# Altium schematic sheet Buck.SchDoc
size A4; DrawnBy: George Evanisko; SheetNumber: 5; SheetTotal: 7
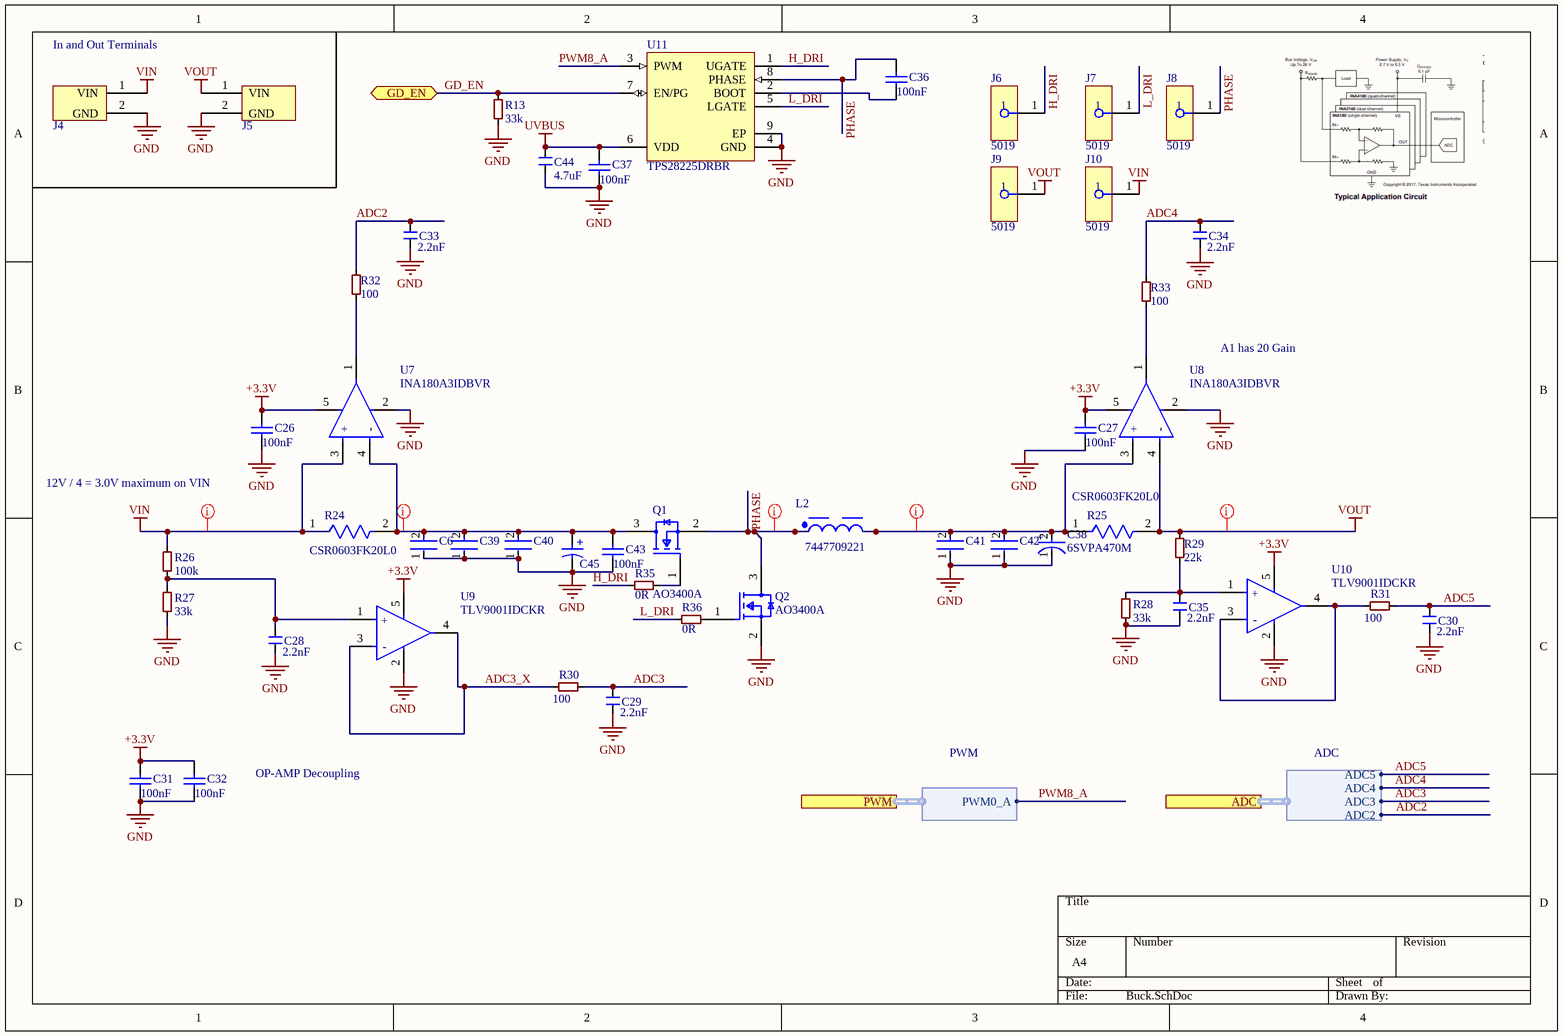
[diagram p0: Buck.SchDoc]

## Parts
C6  GRM31CC81E226ME11L  [FP-GRM31C-0_3-e0_3_0_8-IPC_B]  (value not drawn)
C26  Capacitance: 100nF  [CAPC1050X55X23ML05T13]  (hidden comment: CL05B104KO5NNNC)
C27  Capacitance: 100nF  [CAPC1050X55X23ML05T13]  (hidden comment: CL05B104KO5NNNC)
C28  C: 2.2nF  [0402 Resistor]  (hidden comment: CC0402KRX7R6BB222)
C29  C: 2.2nF  [0402 Resistor]  (hidden comment: CC0402KRX7R6BB222)
C30  C: 2.2nF  [0402 Resistor]  (hidden comment: CC0402KRX7R6BB222)
C31  Capacitance: 100nF  [CAPC1050X55X23ML05T13]  (hidden comment: CL05B104KO5NNNC)
C32  Capacitance: 100nF  [CAPC1050X55X23ML05T13]  (hidden comment: CL05B104KO5NNNC)
C33  C: 2.2nF  [0402 Resistor]  (hidden comment: CC0402KRX7R6BB222)
C34  C: 2.2nF  [0402 Resistor]  (hidden comment: CC0402KRX7R6BB222)
C35  C: 2.2nF  [0402 Resistor]  (hidden comment: CC0402KRX7R6BB222)
C36  Capacitance: 100nF  [CAPC1050X55X23ML05T13]  (hidden comment: CL05B104KO5NNNC)
C37  Capacitance: 100nF  [CAPC1050X55X23ML05T13]  (hidden comment: CL05B104KO5NNNC)
C38  6SVPA470M  [FP-OS-CON-SMT-F8-MFG]
C39  GRM31CC81E226ME11L  [FP-GRM31C-0_3-e0_3_0_8-IPC_B]  (value not drawn)
C40  GRM31CC81E226ME11L  [FP-GRM31C-0_3-e0_3_0_8-IPC_B]  (value not drawn)
C41  GRM31CC81E226ME11L  [FP-GRM31C-0_3-e0_3_0_8-IPC_B]  (value not drawn)
C42  GRM31CC81E226ME11L  [FP-GRM31C-0_3-e0_3_0_8-IPC_B]  (value not drawn)
C43  Capacitance: 100nF  [CAPC1050X55X23ML05T13]  (hidden comment: CL05B104KO5NNNC)
C44  4.7uF  [0402 Resistor]
C45  865060653010  [WCAP-ASLL_D8H10.5]  (value not drawn)
J4  DG127-5.08-02P-14-02A(H)  [DEGSON DG127-5.08-02P-14-02A(H)]  (value not drawn)
J5  DG127-5.08-02P-14-02A(H)  [DEGSON DG127-5.08-02P-14-02A(H)]  (value not drawn)
J6  5019  [5019_MFG]
J7  5019  [5019_MFG]
J8  5019  [5019_MFG]
J9  5019  [5019_MFG]
J10  5019  [5019_MFG]
L2  7447709221  [WE-PD_1210]
Q1  AO3400A  [FP-SOT23-MFG]
Q2  AO3400A  [FP-SOT23-MFG]
R13  R: 33k  [0402 Resistor]  (hidden comment: FRC0402F3302TS)
R24  CSR0603FK20L0  [FP-CSR0603-IPC_C]
R25  CSR0603FK20L0  [FP-CSR0603-IPC_C]
R26  R: 100k  [0402 Resistor]  (hidden comment: FRC0402F1003TS)
R27  R: 33k  [0402 Resistor]  (hidden comment: FRC0402F3302TS)
R28  R: 33k  [0402 Resistor]  (hidden comment: FRC0402F3302TS)
R29  R: 22k  [0402 Resistor]  (hidden comment: FRC0402F2202TS)
R30  R: 100  [0402 Resistor]  (hidden comment: FRC0402F1000TS)
R31  R: 100  [0402 Resistor]  (hidden comment: FRC0402F1000TS)
R32  R: 100  [0402 Resistor]  (hidden comment: FRC0402F1000TS)
R33  R: 100  [0402 Resistor]  (hidden comment: FRC0402F1000TS)
R35  R: 0R  [0402 Resistor]  (hidden comment: FRC0402F0000TS)
R36  R: 0R  [0402 Resistor]  (hidden comment: FRC0402F0000TS)
U7  INA180A3IDBVR  [FP-DBV0005A-IPC_A]
U8  INA180A3IDBVR  [FP-DBV0005A-IPC_A]
U9  TLV9001IDCKR  [FP-DCK0005A-MFG]
U10  TLV9001IDCKR  [FP-DCK0005A-MFG]
U11  TPS28225DRBR  [DRB0008A_V]

## Ports
ADC (harness ADC, see Top_Level[3A], RP2350[1C]), GD_EN (bidir, see Top_Level[3A], RP2350[3C]), PWM (harness PWM, see Top_Level[3B], RP2350[1D])

## Harnesses
ADC: ADC5, ADC4, ADC3, ADC2
PWM: PWM0_A

## Nets
+3.3V: C26.2 C27.2 C31.2 C32.2 U7.5(VS) U8.5(VS) U9.5(V+) U10.5(V+)
GND: C6.1 C26.1 C27.1 C28.1 C29.1 C30.1 C31.1 C32.1 C33.1 C34.1 C35.1 C37.1 C38.1(C) C39.1 C40.1 C41.1 C42.1 C43.1 C44.1 C45.2(N) J4.2(GND) J5.2(GND) Q2.2(S) R13.1 R27.1 R28.1 U7.2(GND) U8.2(GND) U9.2(V-) U10.2(V-) U11.4(GND) U11.9(EP)
UVBUS: C37.2 C44.2 U11.6(VDD)
VIN: J4.1(VIN) J10.1 R24.1 R26.1 U7.3(IN+)
VOUT: J5.1(VIN) J9.1 R25.2 R29.2 U8.4(IN-)
ADC2: C33.2 R32.2 ; port ADC.ADC2
ADC3: C29.2 R30.2 ; port ADC.ADC3
ADC3_X: R30.1 U9.3(IN-) U9.4(OUT)
ADC4: C34.2 R33.2 ; port ADC.ADC4
ADC5: C30.2 R31.2 ; port ADC.ADC5
GD_EN: R13.2 U11.7(EN/PG) ; port GD_EN
H_DRI: J6.1 R35.2 U11.1(UGATE)
L_DRI: J7.1 R36.2 U11.5(LGATE)
PHASE: C36.2 J8.1 L2.1 Q1.2(S) Q2.3(D) U11.8(PHASE)
PWM8_A: U11.3(PWM) ; port PWM.PWM0_A
NetC6_2: C6.2 C39.2 C40.2 C43.2 C45.1(P) Q1.3(D) R24.2 U7.4(IN-)
NetC28_2: C28.2 R26.2 R27.2 U9.1(IN+)
NetC35_2: C35.2 R28.2 R29.1 U10.1(IN+)
NetC36_1: C36.1 U11.2(BOOT)
NetC38_2: C38.2(A) C41.2 C42.2 L2.2 R25.1 U8.3(IN+)
NetQ1_1: Q1.1(G) R35.1
NetQ2_1: Q2.1(G) R36.1
NetR31_1: R31.1 U10.3(IN-) U10.4(OUT)
NetR32_1: R32.1 U7.1(OUT)
NetR33_1: R33.1 U8.1(OUT)

## Layout directives
net class Power: NetC6_2, NetC38_2, PHASE, VIN, VOUT

## Notes on the sheet
- (near J4) In and Out Terminals
- A1 has 20 Gain
- 12V / 4 = 3.0V maximum on VIN
- OP-AMP Decoupling
- (in symbol CMP-03913-54202488-3) +
- (in symbol CMP-04895-000140-1) +; -
- (in symbol CMP-04895-000186-1) +; -
- (in symbol CMP-05428-000400-1) +

## Library data of the parts
C6 C39-C42 = CMP-06035-043516-1: Chip Multilayer Ceramic Capacitors for General Purpose, 1206, 22uF, X6S, 22%, 20%, 25V; Width: 1.6mm; Dielectric: X6S; Thickness: 1.6mm; Capacitance: 22uF; Length: 3.2mm; Voltage Rating (DC): 25V; Tolerance: 20%; LCSC Part #: C415531
C26 C27 C31 C32 C36 C37 C43 = CMP-2000-05439-1: Chip Capacitor, 100 nF, +/- 10%, 16 V, -55 to 125 degC, 0402 (1005 Metric), RoHS, Tape and Reel; Manufacturer: Samsung Electro-Mechanics; Dielectric: X7R; Rated Voltage: 16V; Case Size/Dimension: 0402; Tolerance (%): ±10%; Manufacturer URL: http://www.samsungsem.com/global/index.jsp; Datasheet URL: https://datasheet.ciiva.com/29198/458718-da-01-en-vs-kondensator-0402-29198423.pdf; Datasheet Version: Nov-10; LCSC Part #: C1525; Datasheet: https://www.lcsc.com/datasheet/C1525.pdf
C28-C30 C33-C35 = CC0402KRX7R6BB222: CAP CER 2.2nF 10V X7R 0402; LCSC Part #: C541373
C38 = CMP-05428-000400-1: Conductive Polymer Aluminum Solid Capacitors (OS-CON) 470uF ±20% 6.3V RADIAL SMT 10x7.9mm; ESR (Equivalent Series Resistance): 20mR; Dissipation Factor: 12%; Polarity: Polar; Life (Hours): 2000Hour; Ripple Current: 4.13A; Diameter: 10mm; Series: OS-CON, SVPA; Lead Free: Lead Free; Height: 10.3mm; Package Quantity: 500; RoHS Compliant: Yes; Width: 10.3mm; Tolerance: 20%; Packaging: Tape and Reel; Voltage Rating: 6.3V; Height - Seated (Max): 0.315inch; Voltage Rating (DC): 6.3V; Length: 7.9mm; Mount: Surface Mount; Min Operating Temperature: -55°C; Termination: SMD/SMT; Max Operating Temperature: 105°C; REACH SVHC: No SVHC; Capacitance: 470uF; Case/Package: Radial; LCSC Part #: C3275464
C44 = CL05A475MP5NRNC: CAP CER 4.7uF 10V X5R 0402; C: 4.7uF; LCSC Part #: C23733; Datasheet: https://www.lcsc.com/datasheet/C23733.pdf
C45 = CMP-03913-54202488-3: Alum. Electrolytic Cap 100UF 50V 10.5MMV-CHIP Wcap-asll, Lifetime 5000H +105OC; Tolerance: 20%; Capacitance: 100µF; Impedance: 340mΩ; Polarity: Polar; Ripple Current: 350mA; Insulation Resistance: 1MΩ; Life (Hours): 5000hours; Leakage Current: 50µA; ESR (Equivalent Series Resistance): 227.529mΩ; Voltage Rating (DC): 50V; Case/Package: Radial; Height: 10.5mm; Max Operating Temperature: 105°C; Voltage Rating: 50V; REACH SVHC: Unknown; RoHS: Compliant; Min Operating Temperature: -55°C; Diameter: 8mm; Mount: Surface Mount; Ripple Current (AC): 350mA; Length: 10.5mm; Height - Seated (Max): 10.4902mm
J4 J5 = DG127-5.08-02P-14-02A(H): TERM BLK 2POS 5.08mm TH; LCSC Part #: C691860
J6-J10 = CMP-1672-00008-3: Phosphor Bronze Contact Miniature Silver Plated Surface Mount Test Points; Number of Contacts: 1; ComponentLink1Description: Manufacturer's Website; Number of Pins: 1; Height: 2.42mm; Mount: Surface Mount; HelpURL: https://www.keyelco.com/product-pdf.cfm?p=1357; REACH SVHC: Yes; Packaging: Tape and Reel; Lead Free: Lead Free; ComponentLink1URL: http://www.keyelco.com/; Termination: SMD/SMT; Material: Bronze; Contact Plating: Silver; Contact Material: Silver; RoHS: Compliant; ComponentLink2URL: https://www.keyelco.com/product-pdf.cfm?p=1357; China RoHS: Compliant; Lifecycle Status: Production; ComponentLink2Description: Datasheet URL
L2 = CMP-0227-00173-3: Power-choke We-pd; Max DC Current: 1.8A; Inductance: 220µH; DC Resistance (DCR): 193mΩ; Inductance Tolerance: 20%; Series Resistance: 300mΩ; Test Frequency: 1kHz; Saturation Current: 2.2A; Shielding: Shielded; Core Material: Ferrite; Self Resonant Frequency: 2.2MHz; Height: 10mm; Termination: SMD/SMT; Ambient Temperature Range Low: -40°C; RoHS: Compliant; Case/Package: Nonstandard; Mount: Surface Mount; Case Code (Metric): 3225; RMS Current (Irms): 1.8A; Lead Pitch: 7mm; Length: 12mm; Current Rating: 1.8A; Lead Free: Lead Free; Weight: 4.535924g; Case Code (Imperial): 1210; Width: 12mm; Min Operating Temperature: -40°C; Ambient Temperature Range High: 85°C; Number of Pins: 2; Max Operating Temperature: 125°C; Height - Seated (Max): 10.0076mm; Tolerance: 20%; Composition: Wirewound; Depth: 12mm
Q1 Q2 = CMP-83955-000006-1: MOSFET N-CH 30V 5.7A SOT23; Input Capacitance: 630pF; Number of Elements: 1; Rds On Max: 26.5mR; Max Power Dissipation: 1.4W; Gate to Source Voltage (Vgs): 12V; Min Operating Temperature: -55°C; Lead Free: Lead Free; Number of Pins: 3; Drain to Source Voltage (Vdss): 30V; Case/Package: SOT-23; Mount: Surface Mount; Continuous Drain Current (ID): 5.7A; Radiation Hardening: No; Packaging: Tape and Reel; Max Operating Temperature: 150°C; Power Dissipation: 1.4W
R13 R27 R28 = FRC0402F3302TS: RES 33kΩ ±1% 62.5mW 0402; LCSC Part #: C2909350
R24 R25 = CMP-26527-001190-1: RES 0.02 OHM 1% 1/8W 0603; Max Power Dissipation: 125mW; Temperature Coefficient: 300ppm/°C; Resistance: 20mR; Number of Terminations: 2; Max Operating Temperature: 155°C; Height: 0.022inch; Case/Package: 0603; Tolerance: 1%; Mount: Surface Mount; Case Code (Imperial): 0603; Resistor Type: Thick Film; Series: CSR; Width: 0.031inch; Lead Free: Lead Free; Length: 0.063inch; Min Operating Temperature: -55°C; Packaging: Tape and Reel; RoHS Compliant: Yes; Case Code (Metric): 1608
R26 = FRC0402F1003TS: RES 100kΩ ±1% 62.5mW 0402; LCSC Part #: C2906859
R29 = FRC0402F2202TS: RES 22kΩ ±1% 62.5mW 0402; LCSC Part #: C2909337
R30-R33 = FRC0402F1000TS: RES 100Ω ±1% 62.5mW 0402; LCSC Part #: C2906860
R35 R36 = FRC0402F0000TS: RES 0Ω ±1% 1/16W 0402; LCSC Part #: C2906858
U7 U8 = CMP-04895-000140-1: IC CURR SENSE 1 CIRCUIT SOT23-5; Input Bias Current: 100nA; Input Offset Voltage (Vos): 100uV; Number of Circuits: 1; Slew Rate: 2V/µs; -3db Bandwidth: 350kHz; Operating Supply Current: 260uA; Case/Package: SOT-23-5; Min Operating Temperature: -40°C; Mount: Surface Mount; Packaging: Tape and Reel; Max Operating Temperature: 125°C; LCSC Part #: C122882
U9 U10 = CMP-04895-000186-1: IC CMOS 1 CIRCUIT SC70-5; Number of Channels: 1; Input Bias Current: 5pA; Operating Supply Current: 60uA; Gain Bandwidth Product: 1MHz; Slew Rate: 2V/µs; Input Offset Voltage (Vos): 400uV; Output Current per Channel: 40mA; Max Operating Temperature: 125°C; Min Operating Temperature: -40°C; Mount: Surface Mount; RoHS Compliant: Yes; Packaging: Tape and Reel; Number of Circuits: 1
U11 = CMP-1572-00010-2: High-Frequency Sink Synchronous MOSFET Driver, 4 A, 4.5 to 8 V, -40 to 125 degC, 8-Pin VSON (DRB), RoHS, Tape and Reel; Sink Current: 4 A; Supply Voltage Max: 8 V; Supply Voltage Min: 4.5 V; ComponentLink3URL: http://www.ti.com/lit/ds/symlink/tpa6205a1.pdf; PackageVersion: 4203482-2/K, 06/2012; RoHS: TRUE; ComponentLink2Description: Datasheet; ComponentLink1URL: http://www.ti.com/; DatasheetVersion: SLUS710D; ComponentLink2URL: http://www.ti.com/lit/ds/symlink/tps28225.pdf; Temperature Min: -40 degC; PackageDescription: 8-Pin Plastic Small Outline, Body 3 x 3 mm, Pitch 0.65 mm; Temperature Max: 125 degC; PartNumber: TPS28225; Packing: Tape and Reel; Package Reference: DRB0008A; ComponentLink1Description: Manufacturer URL; ComponentLink3Description: Package Specification; Mounting Technology: Surface Mount